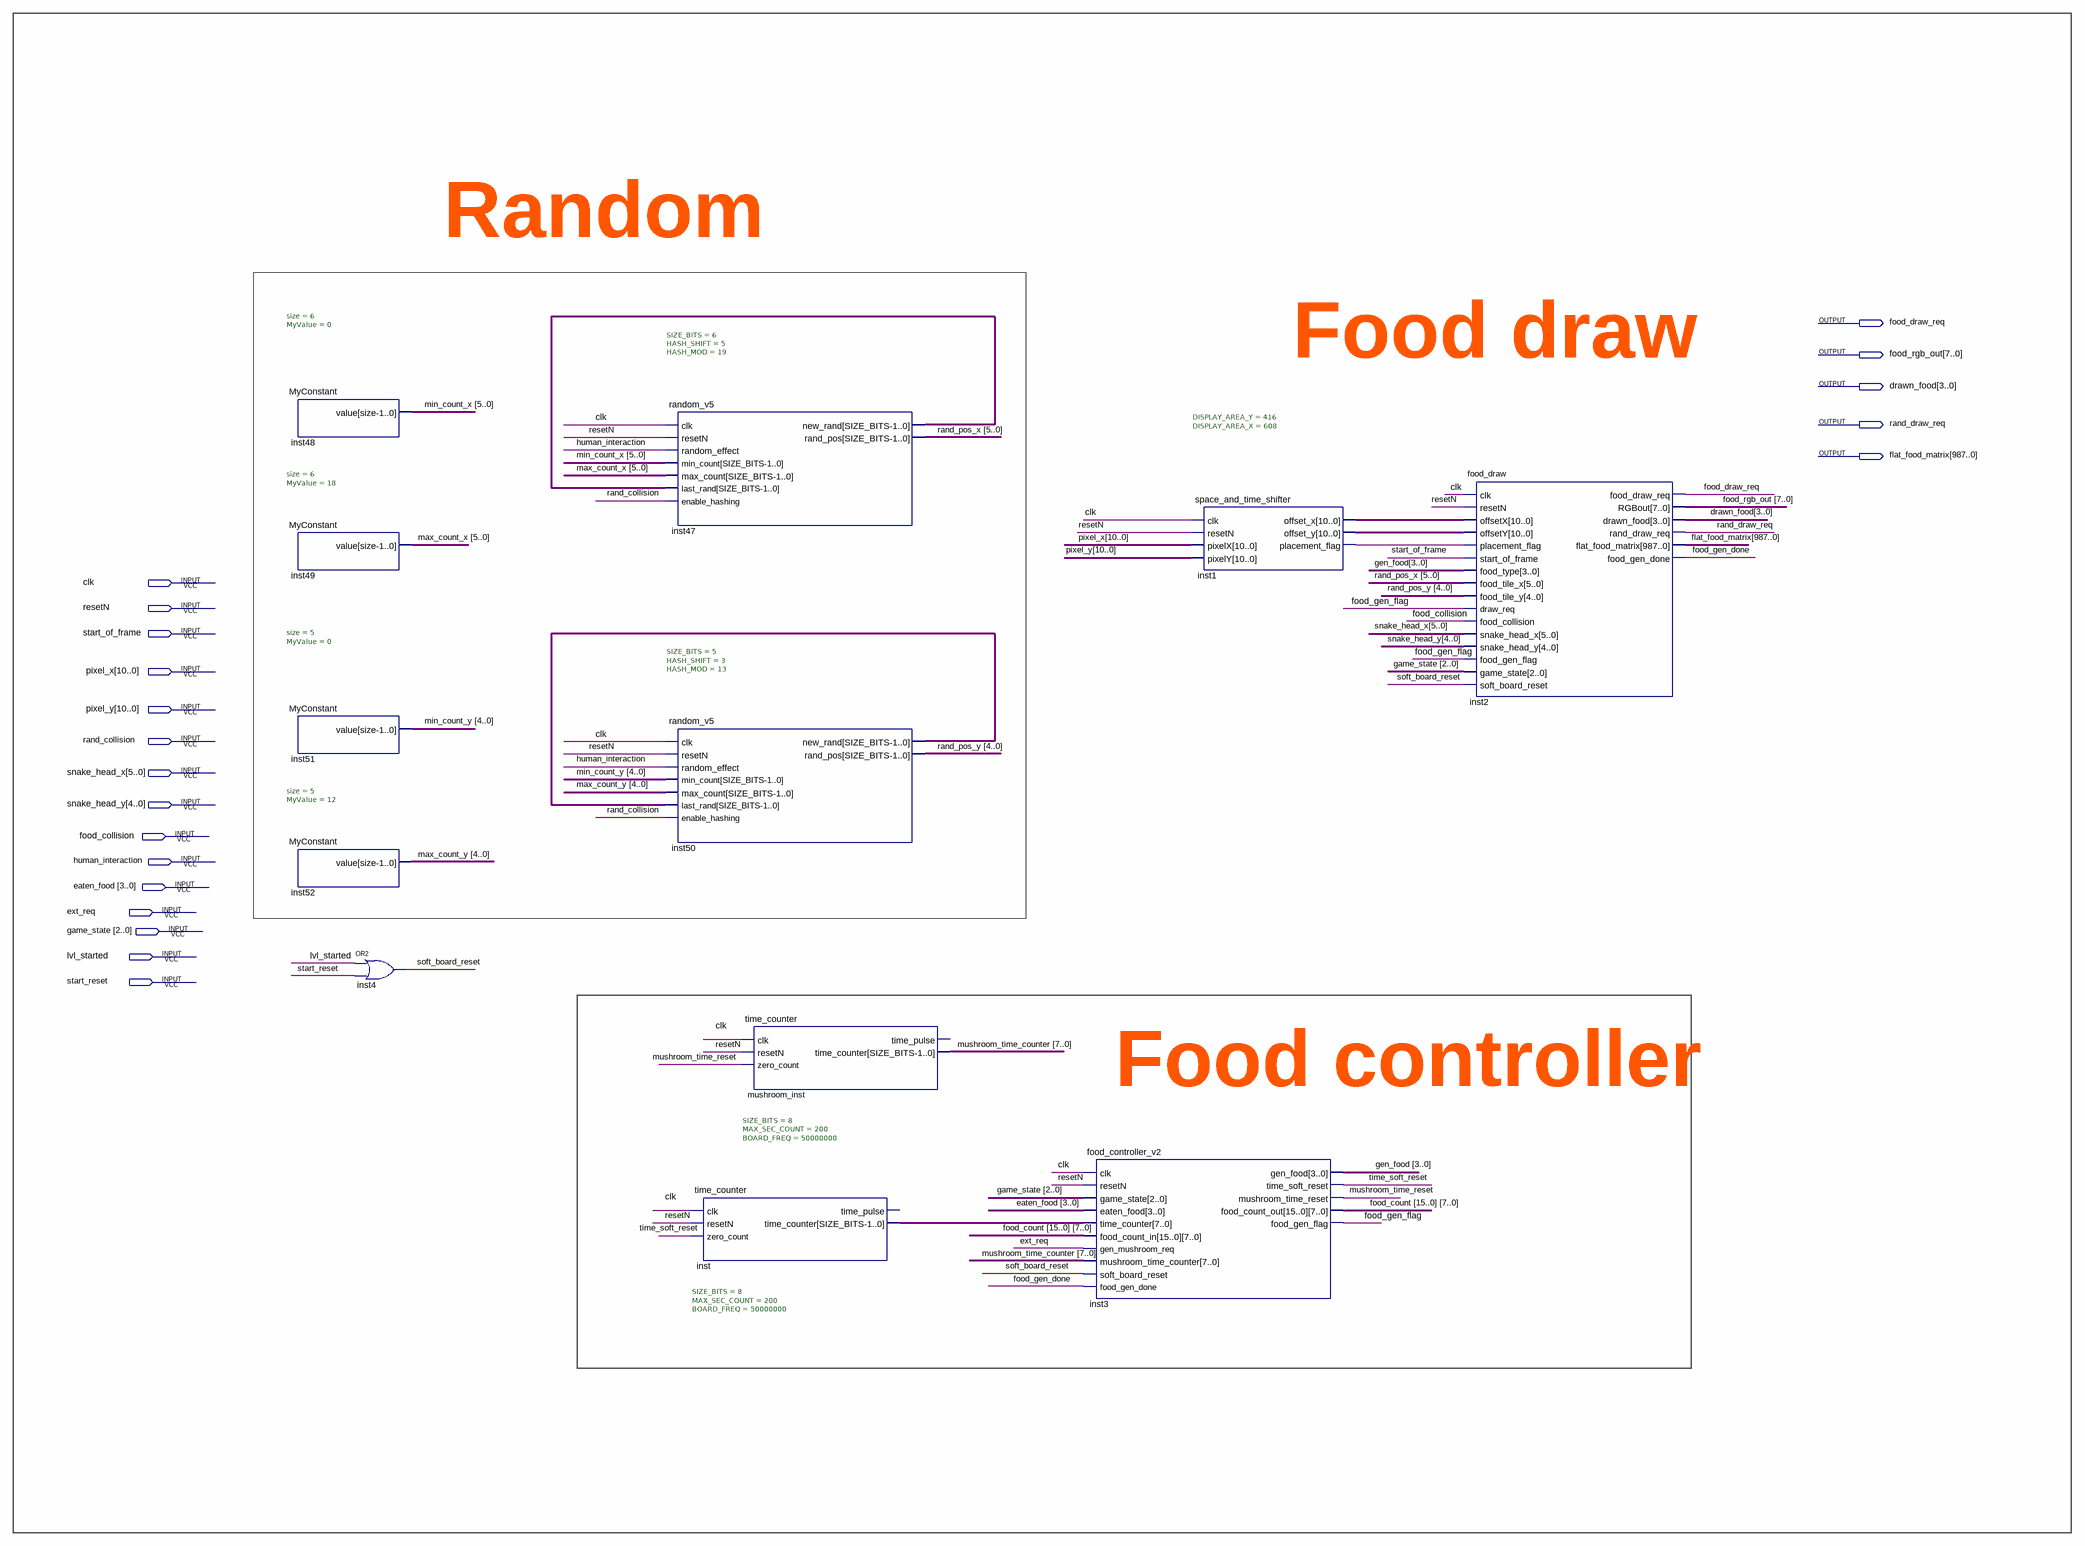
[diagram p0: schematic sheet]
// Quartus schematic food_display.bdf as structural Verilog: 12 symbols, 20 pins
module food_display (
  input  clk,
  input  resetN,
  input  start_of_frame,
  input  [10:0] pixel_x,
  input  [10:0] pixel_y,
  input  rand_collision,
  input  [5:0] snake_head_x,
  input  [4:0] snake_head_y,
  input  food_collision,
  input  human_interaction,
  input  [3:0] eaten_food,
  input  ext_req,
  input  [2:0] game_state,
  input  lvl_started,
  input  start_reset,
  output food_draw_req,
  output [7:0] food_rgb_out,
  output [3:0] drawn_food,
  output rand_draw_req,
  output [987:0] flat_food_matrix
);

  wire food_gen_done, food_gen_flag, inst1_placement_flag, mushroom_time_reset, soft_board_reset,
       time_soft_reset;
  wire [3:0] gen_food;
  wire [4:0] inst50_new_rand, max_count_y, min_count_y, rand_pos_y;
  wire [5:0] inst47_new_rand, max_count_x, min_count_x, rand_pos_x;
  wire [7:0] \food_count_[15..0] , inst_time_counter, mushroom_time_counter;
  wire [10:0] inst1_offset_x, inst1_offset_y;

  MyConstant #(.size(6), .MyValue(0)) inst48 (.value(min_count_x));
  MyConstant #(.size(6), .MyValue(18)) inst49 (.value(max_count_x));
  MyConstant #(.size(5), .MyValue(0)) inst51 (.value(min_count_y));
  MyConstant #(.size(5), .MyValue(12)) inst52 (.value(max_count_y));
  or inst4 (soft_board_reset, lvl_started, start_reset);
  random_v5 #(.SIZE_BITS(6), .HASH_SHIFT(5), .HASH_MOD(19)) inst47 (
    .clk(clk), .resetN(resetN), .random_effect(human_interaction), .min_count(min_count_x),
    .max_count(max_count_x), .last_rand(inst47_new_rand), .enable_hashing(rand_collision),
    .new_rand(inst47_new_rand), .rand_pos(rand_pos_x));
  random_v5 #(.SIZE_BITS(5), .HASH_SHIFT(3), .HASH_MOD(13)) inst50 (
    .clk(clk), .resetN(resetN), .random_effect(human_interaction), .min_count(min_count_y),
    .max_count(max_count_y), .last_rand(inst50_new_rand), .enable_hashing(rand_collision),
    .new_rand(inst50_new_rand), .rand_pos(rand_pos_y));
  time_counter #(.SIZE_BITS(8), .MAX_SEC_COUNT(200), .BOARD_FREQ(50000000)) inst (
    .clk(clk), .resetN(resetN), .zero_count(time_soft_reset), .time_counter(inst_time_counter));  // open: time_pulse
  time_counter #(.SIZE_BITS(8), .MAX_SEC_COUNT(200), .BOARD_FREQ(50000000)) mushroom_inst (
    .clk(clk), .resetN(resetN), .zero_count(mushroom_time_reset), .time_counter(mushroom_time_counter));  // open: time_pulse
  food_controller_v2 inst3 (
    .clk(clk), .resetN(resetN), .game_state(game_state), .eaten_food(eaten_food),
    .time_counter(inst_time_counter), .food_count_in(\food_count_[15..0] ), .gen_mushroom_req(ext_req),
    .mushroom_time_counter(mushroom_time_counter), .soft_board_reset(soft_board_reset),
    .food_gen_done(food_gen_done), .gen_food(gen_food), .time_soft_reset(time_soft_reset),
    .mushroom_time_reset(mushroom_time_reset), .food_count_out(\food_count_[15..0] ),
    .food_gen_flag(food_gen_flag));
  space_and_time_shifter #(.DISPLAY_AREA_Y(416), .DISPLAY_AREA_X(608)) inst1 (
    .clk(clk), .resetN(resetN), .pixelX(pixel_x), .pixelY(pixel_y), .offset_x(inst1_offset_x),
    .offset_y(inst1_offset_y), .placement_flag(inst1_placement_flag));
  food_draw inst2 (
    .clk(clk), .resetN(resetN), .offsetX(inst1_offset_x), .offsetY(inst1_offset_y),
    .placement_flag(inst1_placement_flag), .start_of_frame(start_of_frame), .food_type(gen_food),
    .food_tile_x(rand_pos_x), .food_tile_y(rand_pos_y), .draw_req(food_gen_flag),
    .food_collision(food_collision), .snake_head_x(snake_head_x), .snake_head_y(snake_head_y),
    .food_gen_flag(food_gen_flag), .game_state(game_state), .soft_board_reset(soft_board_reset),
    .food_draw_req(food_draw_req), .RGBout(food_rgb_out), .drawn_food(drawn_food),
    .rand_draw_req(rand_draw_req), .flat_food_matrix(flat_food_matrix), .food_gen_done(food_gen_done));

  // Notes on the sheet:
  //   Random
  //   Food draw
  //   Food controller
endmodule
